# Altium schematic sheet Top-Sheet.SchDoc
size A4; DocumentNumber: 1; SheetNumber: 1; SheetTotal: 5
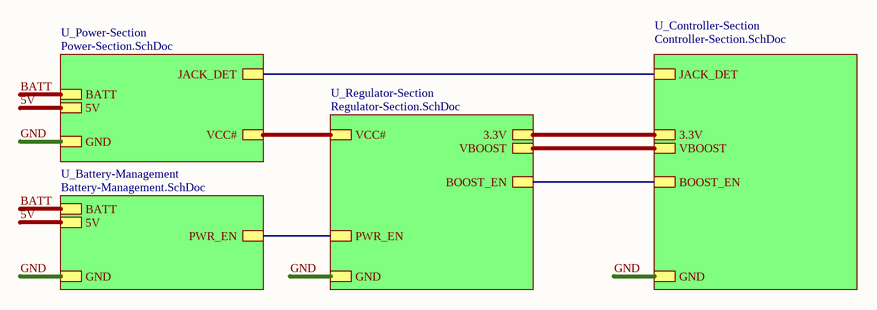
[diagram p0: Top-Sheet.SchDoc]

## Sub-sheets
U_Battery-Management = Battery-Management.SchDoc: BATT, GND, 5V, PWR_EN
U_Controller-Section = Controller-Section.SchDoc: 3.3V, GND, VBOOST, JACK_DET, BOOST_EN
U_Power-Section = Power-Section.SchDoc: VCC#, BATT, GND, JACK_DET, 5V
U_Regulator-Section = Regulator-Section.SchDoc: VCC#, 3.3V, GND, VBOOST, BOOST_EN, PWR_EN

## Nets
5V: sheet U_Power-Section/5V, sheet U_Battery-Management/5V
BATT: sheet U_Power-Section/BATT, sheet U_Battery-Management/BATT
GND: sheet U_Power-Section/GND, sheet U_Regulator-Section/GND, sheet U_Controller-Section/GND, sheet U_Battery-Management/GND
(unnamed): sheet U_Power-Section/VCC#, sheet U_Regulator-Section/VCC#
(unnamed): sheet U_Power-Section/JACK_DET, sheet U_Controller-Section/JACK_DET
(unnamed): sheet U_Regulator-Section/3.3V, sheet U_Controller-Section/3.3V
(unnamed): sheet U_Regulator-Section/VBOOST, sheet U_Controller-Section/VBOOST
(unnamed): sheet U_Regulator-Section/BOOST_EN, sheet U_Controller-Section/BOOST_EN
(unnamed): sheet U_Regulator-Section/PWR_EN, sheet U_Battery-Management/PWR_EN

## Notes on the sheet
- File:
- Title:
- Date:
- Page
- Num:
- Total:
- Drawn By: Huzaifa Ali